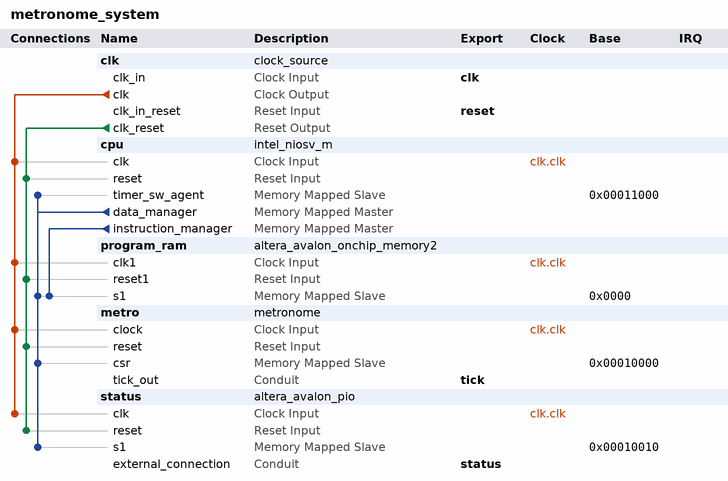
[diagram p0: system contents]
# Platform Designer (Qsys) system metronome_system, Cyclone V 5CEFA4F23C6
# Parameters at their usual value, and those the tool derives, are not listed.
package require -exact qsys 25.1
create_system metronome_system
set_project_property DEVICE_FAMILY {Cyclone V}
set_project_property DEVICE 5CEFA4F23C6

add_instance clk clock_source 25.1
set_instance_parameter_value clk clockFrequency 50000000
set_instance_parameter_value clk resetSynchronousEdges DEASSERT

add_instance cpu intel_niosv_m 26.0.0
set_instance_parameter_value cpu enableAvalonInterface true
set_instance_parameter_value cpu enableDebug false
set_instance_parameter_value cpu enableDebugReset false
set_instance_parameter_value cpu enableECCFull false
set_instance_parameter_value cpu enableECCLite false
set_instance_parameter_value cpu hartId 0
set_instance_parameter_value cpu interruptMode 0
set_instance_parameter_value cpu pipelineArch true
set_instance_parameter_value cpu resetSlave program_ram.s1

add_instance program_ram altera_avalon_onchip_memory2 25.1
set_instance_parameter_value program_ram dataWidth 32
set_instance_parameter_value program_ram dualPort false
set_instance_parameter_value program_ram initMemContent true
set_instance_parameter_value program_ram initializationFileName firmware.hex
set_instance_parameter_value program_ram memorySize 32768
set_instance_parameter_value program_ram useNonDefaultInitFile true

add_instance metro metronome 1.0
set_instance_parameter_value metro CLK_HZ 50000000

add_instance status altera_avalon_pio 25.1
set_instance_parameter_value status direction Output
set_instance_parameter_value status width 32

# connections
add_connection clk.clk cpu.clk clock
add_connection clk.clk metro.clock clock
add_connection clk.clk program_ram.clk1 clock
add_connection clk.clk status.clk clock
add_connection clk.clk_reset cpu.reset reset
add_connection clk.clk_reset metro.reset reset
add_connection clk.clk_reset program_ram.reset1 reset
add_connection clk.clk_reset status.reset reset
add_connection cpu.data_manager cpu.timer_sw_agent avalon
set_connection_parameter_value cpu.data_manager/cpu.timer_sw_agent baseAddress 0x00011000
add_connection cpu.data_manager metro.csr avalon
set_connection_parameter_value cpu.data_manager/metro.csr baseAddress 0x00010000
add_connection cpu.data_manager program_ram.s1 avalon
set_connection_parameter_value cpu.data_manager/program_ram.s1 baseAddress 0x0000
add_connection cpu.data_manager status.s1 avalon
set_connection_parameter_value cpu.data_manager/status.s1 baseAddress 0x00010010
add_connection cpu.instruction_manager program_ram.s1 avalon
set_connection_parameter_value cpu.instruction_manager/program_ram.s1 baseAddress 0x0000

# exported interfaces
add_interface clk clock sink
set_interface_property clk EXPORT_OF clk.clk_in
add_interface reset reset sink
set_interface_property reset EXPORT_OF clk.clk_in_reset
add_interface status conduit end
set_interface_property status EXPORT_OF status.external_connection
add_interface tick conduit end
set_interface_property tick EXPORT_OF metro.tick_out

set_interconnect_requirement {$system} qsys_mm.clockCrossingAdapter HANDSHAKE
set_interconnect_requirement {$system} qsys_mm.enableEccProtection FALSE
set_interconnect_requirement {$system} qsys_mm.insertDefaultSlave FALSE
set_interconnect_requirement {$system} qsys_mm.maxAdditionalLatency 1

save_system metronome_system.qsys
